# Altium schematic sheet 01 POW.SchDoc
size A4; SheetNumber: 1; SheetTotal: 4
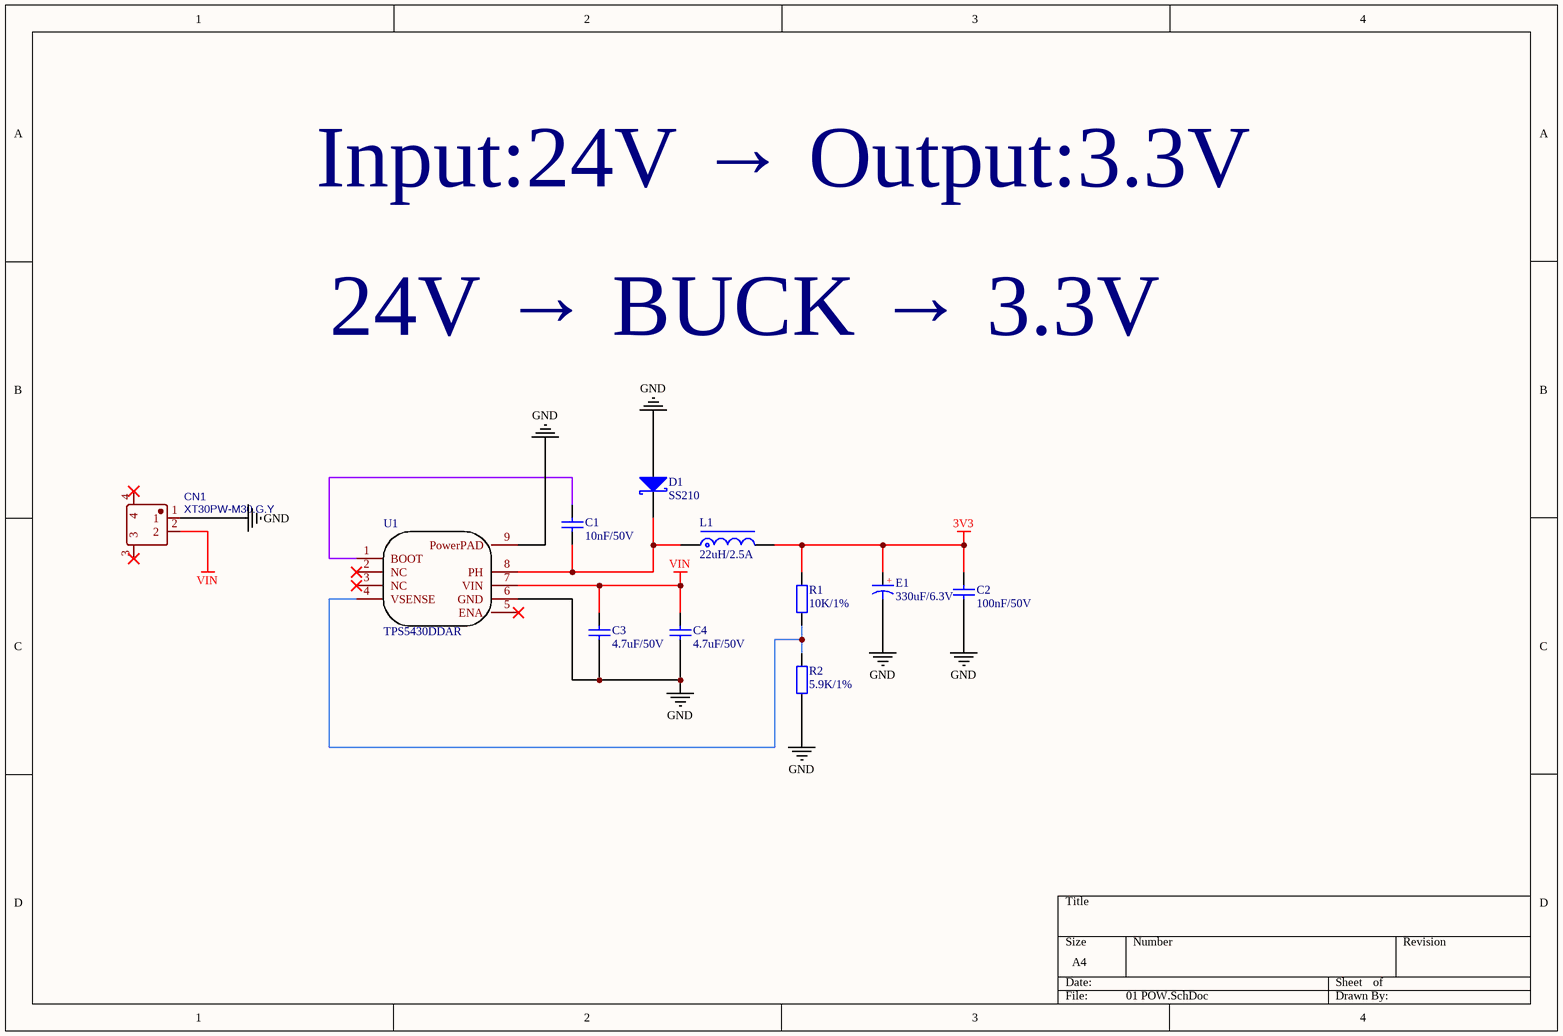
[diagram p0: 01 POW.SchDoc]

## Parts
C1  10nF/50V  [C0603_L]
C2  100nF/50V  [C0603_L]
C3  4.7uF/50V  [C1206_L]
C4  4.7uF/50V  [C1206_L]
CN1  XT30PW-M30.G.Y  [XT30PW-M]
D1  SS210  [SMA]
E1  330uF/6.3V  [CE D(6.3*5.4)]
L1  22uH/2.5A  [L-SMD-0630]
R1  10K/1%  [R0603_L]
R2  5.9K/1%  [R0603_L]
U1  TPS5430DDAR  [SOIC-8_EP]

## Nets
3V3: C2.2 E1.1 L1.2 R1.2
GND: C2.1 C3.1 C4.1 CN1.1 D1.1(A) E1.2 R2.1 U1.6(GND) U1.9(PowerPAD)
VIN: C3.2 C4.2 CN1.2 U1.7(VIN)
NetC1_1: C1.1 D1.2(K) L1.1 U1.8(PH)
NetC1_2: C1.2 U1.1(BOOT)
NetR1_1: R1.1 R2.2 U1.4(VSENSE)

Not connected (* = marked no-connect by the designer): CN1 3* 4*; U1 2(NC)* 3(NC)* 5(ENA)*

## Notes on the sheet
- Input:24V → Output:3.3V
- 24V → BUCK → 3.3V
- (in symbol CE_SMD) +

## Library data of the parts
C1 = C: 0603B103K500NT; BOM名称: 无极性贴片电容; 联系卖家，免费查找封装: 唯一出售店铺网址https://shop463601444.taobao.com
C2 = C: CC0603KRX7R9BB104; BOM名称: 无极性贴片电容; 联系卖家，免费查找封装: 唯一出售店铺网址https://shop463601444.taobao.com
C3 C4 = C: 1206B475K500NT; BOM名称: 无极性贴片电容; 联系卖家，免费查找封装: 唯一出售店铺网址https://shop463601444.taobao.com
CN1 = XT30PW-M: BOM_Manufacturer: Changzhou Amass Elec; Contributor: LCSC; BOM_Supplier: LCSC; BOM_Supplier Part: C431092; BOM_Manufacturer Part: XT30PW-M; BOM_JLCPCB Part Class: Extended Part; spicePre: C; spiceSymbolName: XT30PW-M
D1 = SS14: BOM名称: 肖特基二极管; 属性: 40V/1A; 联系卖家，免费查找封装: 唯一出售店铺网址https://shop463601444.taobao.com
E1 = CE_SMD: RVT0J331M0605; BOM名称: 贴片电解电容; 联系卖家，免费查找封装: 唯一出售店铺网址https://shop463601444.taobao.com
L1 = L-Molding Choke: FXL0630-220-M; BOM名称: 一体成型电感; 联系卖家，免费查找封装: 唯一出售店铺网址https://shop463601444.taobao.com
R1 = R: 0603WAF1002T5E; BOM名称: 贴片电阻; 联系卖家，免费查找封装: 唯一出售店铺网址https://shop463601444.taobao.com
R2 = R: 0603WAF5901T5E; BOM名称: 贴片电阻; 联系卖家，免费查找封装: 唯一出售店铺网址https://shop463601444.taobao.com